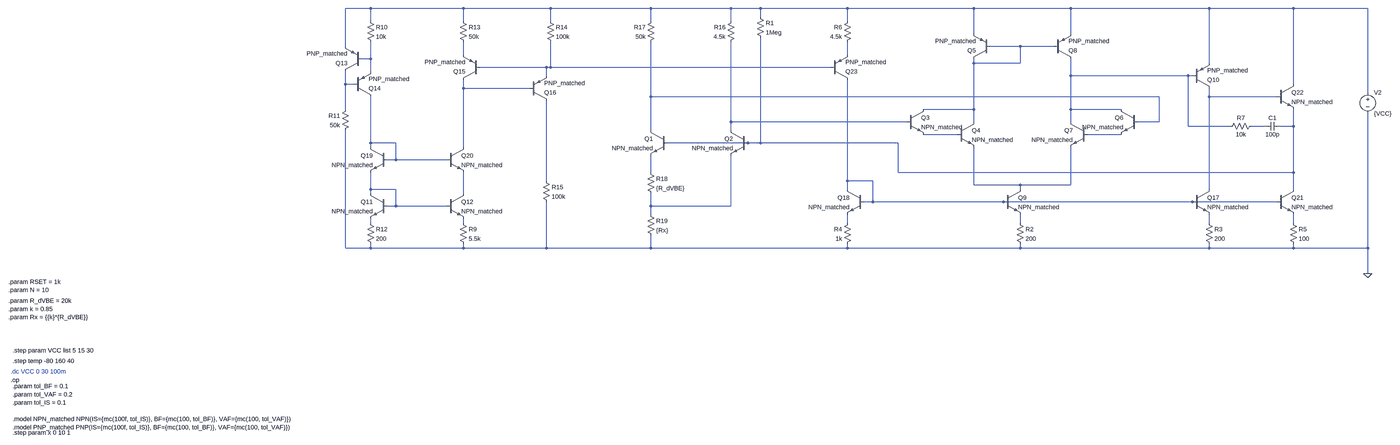
[diagram p0: schematic Brokaw_Bandgap_Reference_All_Transistors.asc, whole sheet]
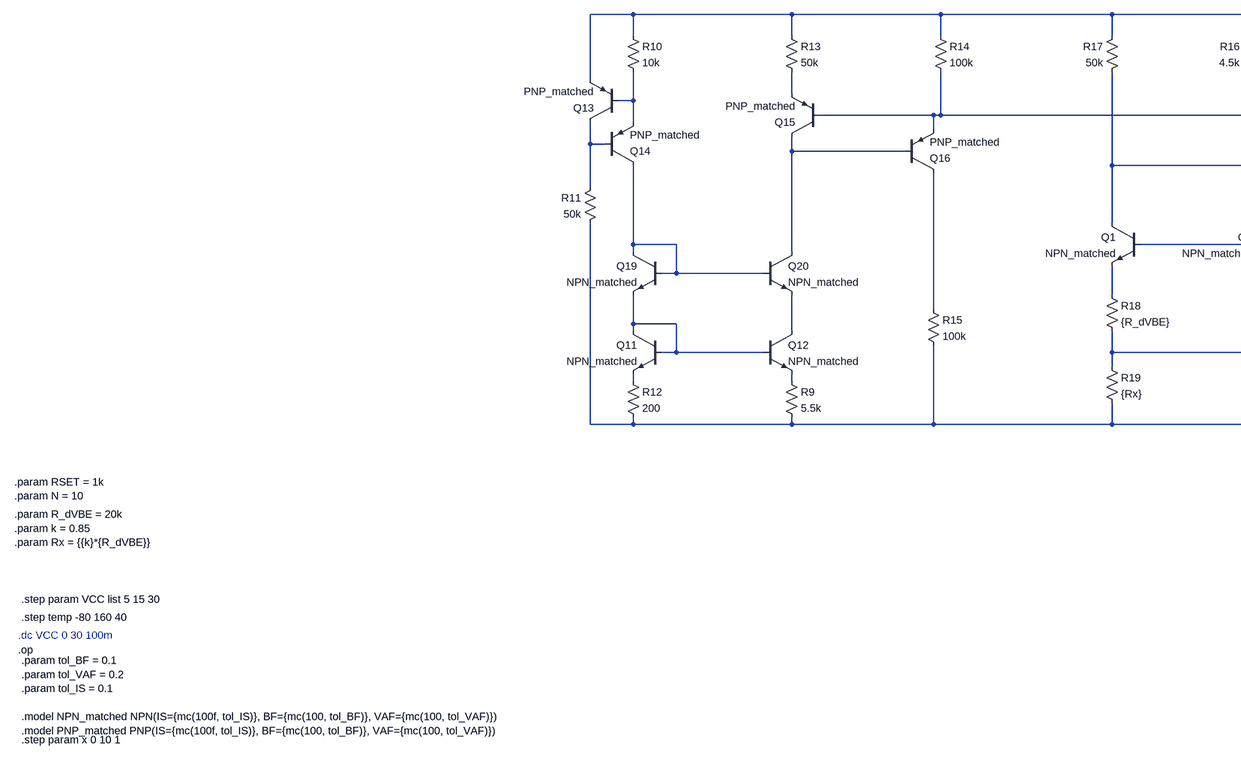
[diagram p1: schematic Brokaw_Bandgap_Reference_All_Transistors.asc, part, row 1 of 1, column 1 of 2]
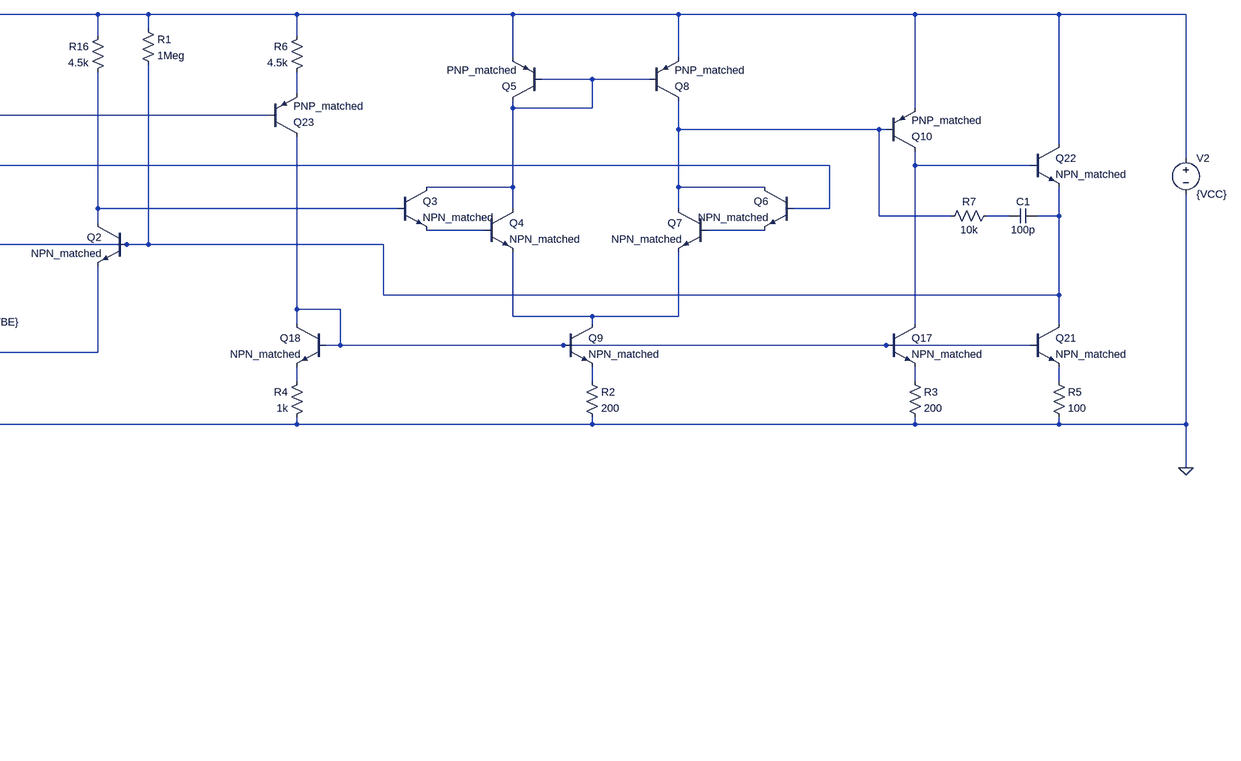
[diagram p2: schematic Brokaw_Bandgap_Reference_All_Transistors.asc, part, row 1 of 1, column 2 of 2]
Brokaw_Bandgap_Reference_All_Transistors.asc, the LTspice schematic file:
Version 4.1
SHEET 1 6228 1716
WIRE 912 -368 816 -368
WIRE 1264 -368 912 -368
WIRE 1632 -368 1264 -368
WIRE 2048 -368 1632 -368
WIRE 2352 -368 2048 -368
WIRE 2464 -368 2352 -368
WIRE 3168 -368 2464 -368
WIRE 3648 -368 3168 -368
WIRE 4016 -368 3648 -368
WIRE 4592 -368 4016 -368
WIRE 4912 -368 4592 -368
WIRE 5664 -368 4912 -368
WIRE 2464 -336 2464 -368
WIRE 912 -320 912 -368
WIRE 1264 -320 1264 -368
WIRE 1632 -320 1632 -368
WIRE 2048 -320 2048 -368
WIRE 2352 -320 2352 -368
WIRE 3168 -320 3168 -368
WIRE 3648 -272 3648 -368
WIRE 4016 -272 4016 -368
WIRE 816 -224 816 -368
WIRE 3824 -224 3712 -224
WIRE 3952 -224 3824 -224
WIRE 1264 -192 1264 -240
WIRE 3168 -192 3168 -240
WIRE 912 -176 912 -240
WIRE 912 -176 880 -176
WIRE 3648 -160 3648 -176
WIRE 3824 -160 3824 -224
WIRE 3824 -160 3648 -160
WIRE 4592 -160 4592 -368
WIRE 1616 -144 1328 -144
WIRE 1632 -144 1632 -240
WIRE 1632 -144 1616 -144
WIRE 3104 -144 1632 -144
WIRE 912 -128 912 -176
WIRE 1616 -112 1616 -144
WIRE 4016 -112 4016 -176
WIRE 4512 -112 4016 -112
WIRE 4528 -112 4512 -112
WIRE 816 -80 816 -128
WIRE 848 -80 816 -80
WIRE 4912 -80 4912 -368
WIRE 1264 -64 1264 -96
WIRE 1552 -64 1264 -64
WIRE 5664 -48 5664 -368
WIRE 2048 -32 2048 -240
WIRE 4352 -32 2048 -32
WIRE 4592 -32 4592 -64
WIRE 4848 -32 4592 -32
WIRE 816 16 816 -80
WIRE 3648 16 3648 -160
WIRE 3648 16 3456 16
WIRE 4016 16 4016 -112
WIRE 4208 16 4016 16
WIRE 2352 64 2352 -240
WIRE 3392 64 2352 64
WIRE 3648 64 3648 16
WIRE 4016 64 4016 16
WIRE 4352 64 4352 -32
WIRE 4352 64 4272 64
WIRE 4512 80 4512 -112
WIRE 4672 80 4512 80
WIRE 4800 80 4752 80
WIRE 4912 80 4912 16
WIRE 4912 80 4864 80
WIRE 2048 96 2048 -32
WIRE 2352 96 2352 64
WIRE 3584 112 3456 112
WIRE 4208 112 4080 112
WIRE 912 144 912 -32
WIRE 1008 144 912 144
WIRE 2416 144 2112 144
WIRE 2464 144 2464 -256
WIRE 2464 144 2416 144
WIRE 3360 144 2464 144
WIRE 912 160 912 144
WIRE 1264 160 1264 -64
WIRE 1008 208 1008 144
WIRE 1008 208 976 208
WIRE 1200 208 1008 208
WIRE 2048 256 2048 192
WIRE 3360 256 3360 144
WIRE 4912 256 4912 80
WIRE 4912 256 3360 256
WIRE 1616 288 1616 -16
WIRE 3168 288 3168 -96
WIRE 3264 288 3168 288
WIRE 3648 304 3648 160
WIRE 3824 304 3648 304
WIRE 4016 304 4016 160
WIRE 4016 304 3824 304
WIRE 912 320 912 256
WIRE 1008 320 912 320
WIRE 3168 320 3168 288
WIRE 3824 320 3824 304
WIRE 4592 320 4592 -32
WIRE 4912 320 4912 256
WIRE 912 336 912 320
WIRE 1264 336 1264 256
WIRE 3264 368 3264 288
WIRE 3264 368 3232 368
WIRE 3760 368 3264 368
WIRE 4528 368 3760 368
WIRE 4848 368 4528 368
WIRE 1008 384 1008 320
WIRE 1008 384 976 384
WIRE 1200 384 1008 384
WIRE 2048 384 2048 336
WIRE 2352 384 2352 192
WIRE 2352 384 2048 384
WIRE 2048 416 2048 384
WIRE 912 448 912 432
WIRE 1264 448 1264 432
WIRE 3168 448 3168 416
WIRE 3824 448 3824 416
WIRE 4592 448 4592 416
WIRE 4912 448 4912 416
WIRE 816 544 816 96
WIRE 912 544 912 528
WIRE 912 544 816 544
WIRE 1264 544 1264 528
WIRE 1264 544 912 544
WIRE 1616 544 1616 368
WIRE 1616 544 1264 544
WIRE 2048 544 2048 496
WIRE 2048 544 1616 544
WIRE 3168 544 3168 528
WIRE 3168 544 2048 544
WIRE 3824 544 3824 528
WIRE 3824 544 3168 544
WIRE 4592 544 4592 528
WIRE 4592 544 3824 544
WIRE 4912 544 4912 528
WIRE 4912 544 4592 544
WIRE 5664 544 5664 32
WIRE 5664 544 4912 544
WIRE 5664 640 5664 544
FLAG 5664 640 0
SYMBOL npn 976 336 M0
SYMATTR InstName Q11
SYMATTR Value NPN_matched
SYMBOL npn 1200 336 R0
SYMATTR InstName Q12
SYMATTR Value NPN_matched
SYMBOL res 1248 432 R0
SYMATTR InstName R9
SYMATTR Value 5.5k
SYMBOL res 896 -336 R0
SYMATTR InstName R10
SYMATTR Value 10k
SYMBOL pnp 880 -128 R180
SYMATTR InstName Q13
SYMATTR Value PNP_matched
SYMBOL pnp 848 -32 M180
SYMATTR InstName Q14
SYMATTR Value PNP_matched
SYMBOL res 832 0 M0
SYMATTR InstName R11
SYMATTR Value 50k
SYMBOL res 896 432 R0
SYMATTR InstName R12
SYMATTR Value 200
SYMBOL res 1248 -336 R0
SYMATTR InstName R13
SYMATTR Value 50k
SYMBOL pnp 1328 -96 R180
SYMATTR InstName Q15
SYMATTR Value PNP_matched
SYMBOL pnp 1552 -16 M180
SYMATTR InstName Q16
SYMATTR Value PNP_matched
SYMBOL res 1616 -336 R0
SYMATTR InstName R14
SYMATTR Value 100k
SYMBOL res 2368 -336 M0
SYMATTR InstName R16
SYMATTR Value 4.5k
SYMBOL res 1600 272 R0
SYMATTR InstName R15
SYMATTR Value 100k
SYMBOL res 2064 -336 M0
SYMATTR InstName R17
SYMATTR Value 50k
SYMBOL voltage 5664 -64 R0
WINDOW 123 0 0 Left 0
WINDOW 39 0 0 Left 0
SYMATTR InstName V2
SYMATTR Value {VCC}
SYMBOL res 2032 240 R0
SYMATTR InstName R18
SYMATTR Value {R_dVBE}
SYMBOL res 2032 400 R0
SYMATTR InstName R19
SYMATTR Value {Rx}
SYMBOL npn 2112 96 M0
SYMATTR InstName Q1
SYMATTR Value NPN_matched
SYMBOL npn 2416 96 M0
SYMATTR InstName Q2
SYMATTR Value NPN_matched
SYMBOL res 2448 -352 R0
SYMATTR InstName R1
SYMATTR Value 1Meg
SYMBOL npn 3392 16 R0
SYMATTR InstName Q3
SYMATTR Value NPN_matched
SYMBOL npn 3584 64 R0
SYMATTR InstName Q4
SYMATTR Value NPN_matched
SYMBOL pnp 3712 -176 R180
SYMATTR InstName Q5
SYMATTR Value PNP_matched
SYMBOL npn 4272 16 M0
SYMATTR InstName Q6
SYMATTR Value NPN_matched
SYMBOL npn 4080 64 M0
SYMATTR InstName Q7
SYMATTR Value NPN_matched
SYMBOL pnp 3952 -176 M180
SYMATTR InstName Q8
SYMATTR Value PNP_matched
SYMBOL npn 3760 320 R0
SYMATTR InstName Q9
SYMATTR Value NPN_matched
SYMBOL res 3808 432 R0
SYMATTR InstName R2
SYMATTR Value 200
SYMBOL pnp 4528 -64 M180
SYMATTR InstName Q10
SYMATTR Value PNP_matched
SYMBOL npn 4528 320 R0
SYMATTR InstName Q17
SYMATTR Value NPN_matched
SYMBOL res 4576 432 R0
SYMATTR InstName R3
SYMATTR Value 200
SYMBOL npn 3232 320 M0
SYMATTR InstName Q18
SYMATTR Value NPN_matched
SYMBOL res 3184 432 M0
SYMATTR InstName R4
SYMATTR Value 1k
SYMBOL npn 4848 320 R0
SYMATTR InstName Q21
SYMATTR Value NPN_matched
SYMBOL res 4896 432 R0
SYMATTR InstName R5
SYMATTR Value 100
SYMBOL npn 4848 -80 R0
SYMATTR InstName Q22
SYMATTR Value NPN_matched
SYMBOL npn 976 160 M0
SYMATTR InstName Q19
SYMATTR Value NPN_matched
SYMBOL npn 1200 160 R0
SYMATTR InstName Q20
SYMATTR Value NPN_matched
SYMBOL res 3184 -336 M0
SYMATTR InstName R6
SYMATTR Value 4.5k
SYMBOL pnp 3104 -96 M180
SYMATTR InstName Q23
SYMATTR Value PNP_matched
SYMBOL cap 4864 64 R90
WINDOW 0 0 32 VBottom 2
WINDOW 3 32 32 VTop 2
SYMATTR InstName C1
SYMATTR Value 100p
SYMBOL res 4768 64 R90
WINDOW 0 0 56 VBottom 2
WINDOW 3 32 56 VTop 2
SYMATTR InstName R7
SYMATTR Value 10k
TEXT -464 672 Left 2 !.param RSET = 1k\n.param N = 10
TEXT -464 744 Left 2 !.param R_dVBE = 20k\n.param k = 0.85\n.param Rx = {{k}*{R_dVBE}}
TEXT -456 1048 Left 2 ;.dc VCC 0 30 100m
TEXT -448 1008 Left 2 !.step temp -80 160 40
TEXT -448 1104 Left 2 !.param tol_BF = 0.1\n.param tol_VAF = 0.2\n.param tol_IS = 0.1\n \n.model NPN_matched NPN(IS={mc(100f, tol_IS)}, BF={mc(100, tol_BF)}, VAF={mc(100, tol_VAF)})\n.model PNP_matched PNP(IS={mc(100f, tol_IS)}, BF={mc(100, tol_BF)}, VAF={mc(100, tol_VAF)})
TEXT -448 1280 Left 2 !.step param x 0 10 1
TEXT -456 1080 Left 2 !.op
TEXT -448 968 Left 2 !.step param VCC list 5 15 30

The netlist it stands for:
* Brokaw_Bandgap_Reference_All_Transistors.asc
Q11 N022 N022 N025 0 NPN_matched
Q12 N023 N022 N026 0 NPN_matched
R9 N026 0 5.5k
R10 N001 N005 10k
Q13 N008 N005 N001 0 PNP_matched
Q14 N017 N008 N005 0 PNP_matched
R11 N008 0 50k
R12 N025 0 200
R13 N001 N003 50k
Q15 N009 N006 N003 0 PNP_matched
Q16 N019 N009 N006 0 PNP_matched
R14 N001 N006 100k
R16 N001 N012 4.5k
R15 N019 0 100k
R17 N001 N010 50k
V2 N001 0 {VCC}
R18 N018 N024 {R_dVBE}
R19 N024 0 {Rx}
Q1 N010 N014 N018 0 NPN_matched
Q2 N012 N014 N024 0 NPN_matched
R1 N001 N014 1Meg
Q3 N002 N012 N015 0 NPN_matched
Q4 N002 N015 N021 0 NPN_matched
Q5 N002 N002 N001 0 PNP_matched
Q6 N007 N010 N016 0 NPN_matched
Q7 N007 N016 N021 0 NPN_matched
Q8 N007 N002 N001 0 PNP_matched
Q9 N021 N020 N028 0 NPN_matched
R2 N028 0 200
Q10 N011 N007 N001 0 PNP_matched
Q17 N011 N020 N029 0 NPN_matched
R3 N029 0 200
Q18 N020 N020 N027 0 NPN_matched
R4 N027 0 1k
Q21 N014 N020 N030 0 NPN_matched
R5 N030 0 100
Q22 N001 N011 N014 0 NPN_matched
Q19 N017 N017 N022 0 NPN_matched
Q20 N009 N017 N023 0 NPN_matched
R6 N001 N004 4.5k
Q23 N020 N006 N004 0 PNP_matched
C1 N014 N013 100p
R7 N013 N007 10k
.model NPN NPN
.model PNP PNP
.lib standard.bjt
.param RSET = 1k
.param N = 10
.param R_dVBE = 20k
.param k = 0.85
.param Rx = {{k}*{R_dVBE}}
* .dc VCC 0 30 100m
.step temp -80 160 40
.param tol_BF = 0.1
.param tol_VAF = 0.2
.param tol_IS = 0.1
.model NPN_matched NPN(IS={mc(100f, tol_IS)}, BF={mc(100, tol_BF)}, VAF={mc(100, tol_VAF)})
.model PNP_matched PNP(IS={mc(100f, tol_IS)}, BF={mc(100, tol_BF)}, VAF={mc(100, tol_VAF)})
.step param x 0 10 1
.op
.step param VCC list 5 15 30
.backanno
.end